# Altium schematic sheet CH32L103F8U-R0.SchDoc
size 304 x 254 mm
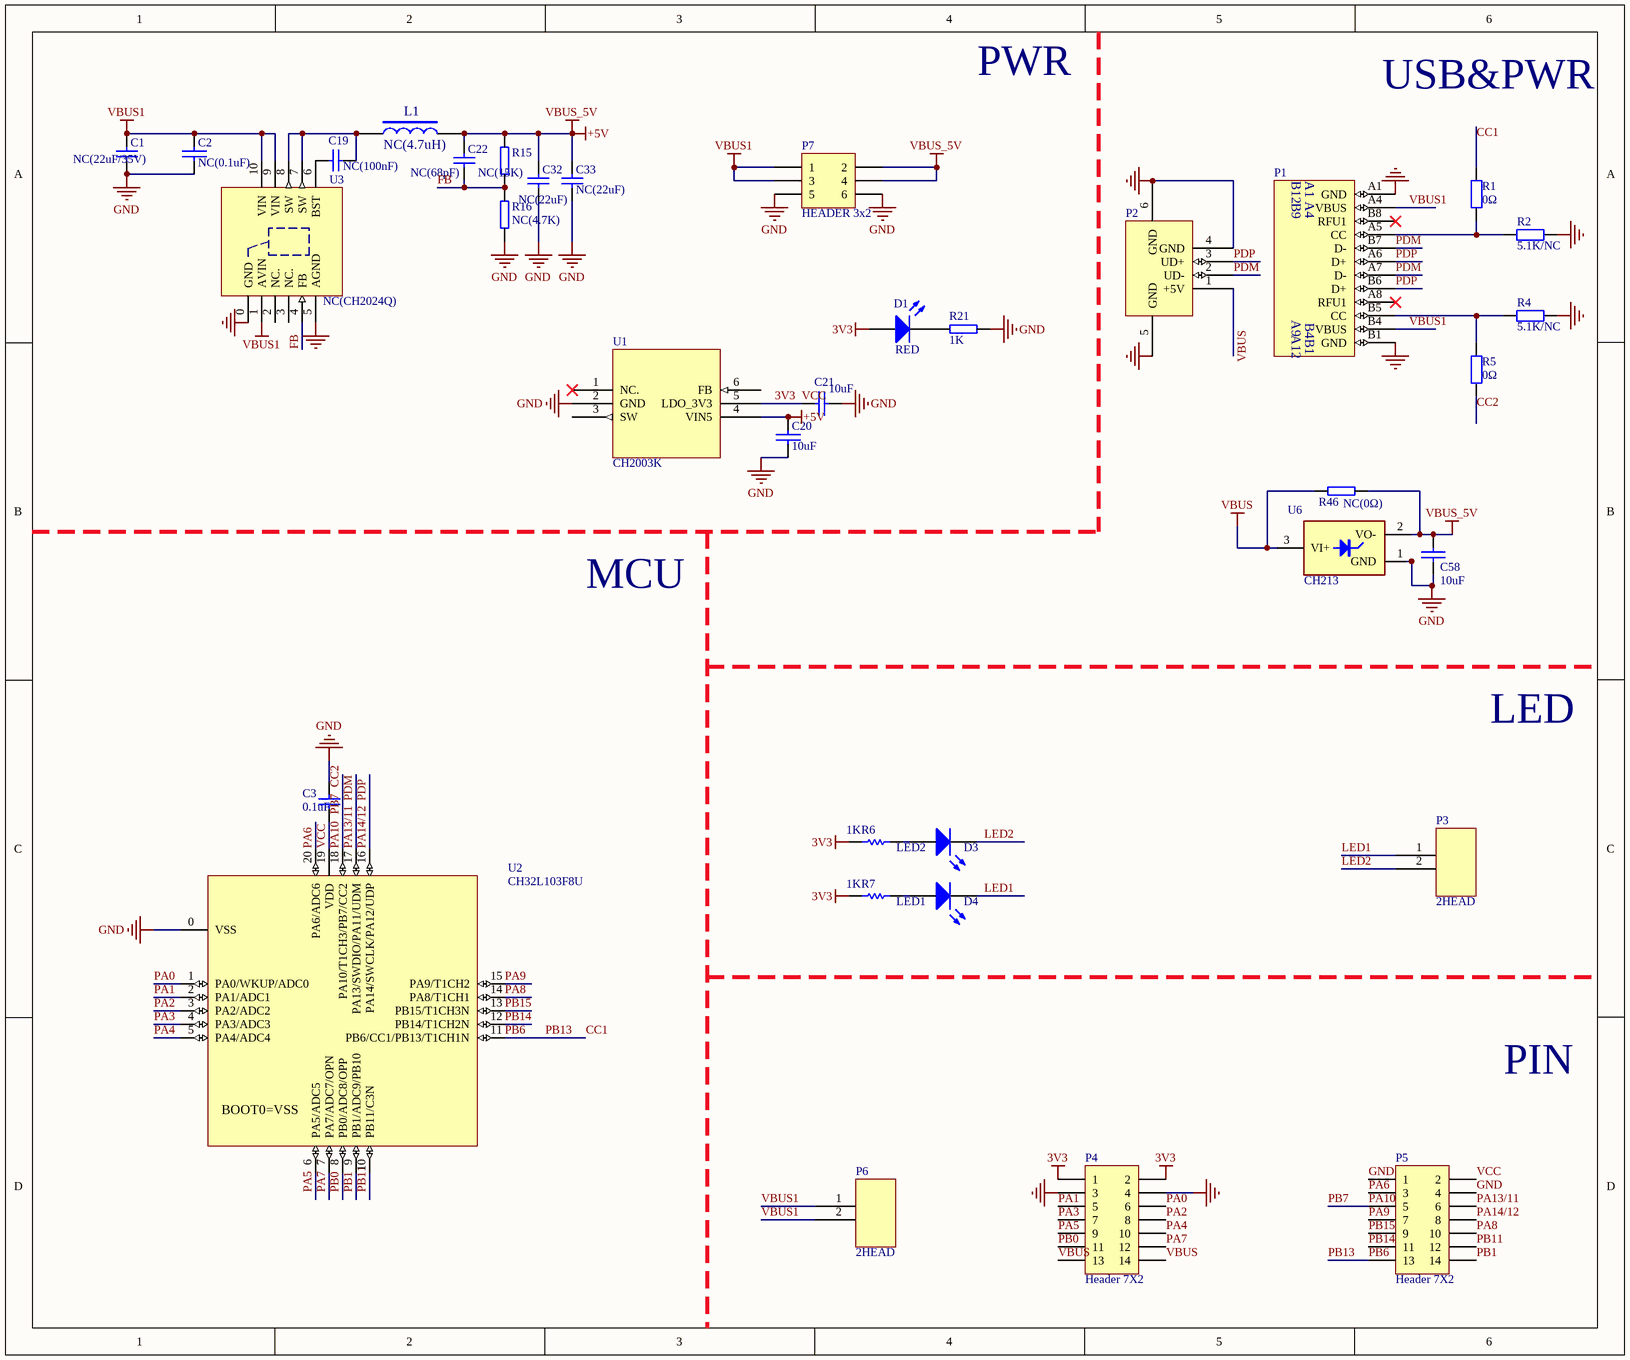
[diagram p0: CH32L103F8U-R0.SchDoc]

## Parts
C1  NC(22uF/35V)  [0805_C]
C2  NC(0.1uF)  [0402_C]
C3  0.1uF  [0603_C]
C19  NC(100nF)  [0402_C]
C20  10uF  [0603_C]
C21  10uF  [0603_C]
C22  NC(68pF)  [0402_C]
C32  NC(22uF)  [0805_C]
C33  NC(22uF)  [0805_C]
C58  10uF  [0603_C]
D1  RED  [0603+]
D3  LED2  [0603+]
D4  LED1  [0603+]
L1  NC(4.7uH)  [IND-SMD_L7.0-W6.6]
P1  TYPE-C  [TYPE-C-Receptacle-2.0]  (value not drawn)
P2  USB_A  [USBAF]  (value not drawn)
P3  2HEAD  [SIP2-2.54mm]
P4  Header 7X2  [IDC14-2.54mm]
P5  Header 7X2  [IDC14-2.54mm]
P6  2HEAD  [SIP2-2.54mm]
P7  HEADER 3x2  [IDC6-2.54mm]
R1  0Ω  [0603]
R2  5.1K/NC  [0603]
R4  5.1K/NC  [0603]
R5  0Ω  [0603]
R6  1K  [0603]
R7  1K  [0603]
R15  NC(15K)  [0402]
R16  NC(4.7K)  [0402]
R21  1K  [0402]
R46  NC(0Ω)  [0402]
U1  CH2003K  [SOT-23-6]
U2  CH32L103F8U  [QFN20_3X3]
U3  NC(CH2024Q)  [DFN10_3X3]
U6  CH213  [SOT-23-3]

## Nets
3V3: C3.1 C21.2 D1.1(A) P4.1 P4.2 P5.2 R6.1 R7.1 U1.5(LDO_3V3) U2.19(VDD)  [also labelled VCC]
+5V: C20.2 C22.1 C32.2 C33.2 C58.1 L1.2 P7.2 P7.4 R15.2 R46.1 U1.4(VIN5) U6.2(VO-)  [also labelled VBUS_5V]
GND: C1.1 C2.1 C3.2 C20.1 C21.1 C32.1 C33.1 C58.2 P1.A1(GND) P1.B1(GND) P2.4(GND) P2.5(GND) P2.6(GND) P4.3 P4.4 P5.1 P5.4 P7.5 P7.6 R2.2 R4.2 R16.1 R21.2 U1.2(GND) U2.0(VSS) U3.0(GND) U3.5(AGND) U6.1(GND)
VBUS: P2.1(+5V) P4.13 P4.14 R46.2 U6.3(VI+)
VBUS1: C1.2 C2.2 P1.A4(VBUS) P1.B4(VBUS) P6.1 P6.2 P7.1 P7.3 U3.1(AVIN) U3.9(VIN) U3.10(VIN)
CC1: P5.13 R1.2 U2.11(PB6/CC1/PB13/T1CH1N)  [also labelled PB13, PB6]
CC2: P5.5 R5.1 U2.18(PA10/T1CH3/PB7/CC2)  [also labelled PA10, PB7]
FB: C22.2 R15.1 R16.2 U3.4(FB)
LED1: D4.2(K) P3.1
LED2: D3.2(K) P3.2
PA0: P4.6 U2.1(PA0/WKUP/ADC0)
PA1: P4.5 U2.2(PA1/ADC1)
PA2: P4.8 U2.3(PA2/ADC2)
PA3: P4.7 U2.4(PA3/ADC3)
PA4: P4.10 U2.5(PA4/ADC4)
PA5: P4.9 U2.6(PA5/ADC5)
PA6: P5.3 U2.20(PA6/ADC6)
PA7: P4.12 U2.7(PA7/ADC7/OPN)
PA8: P5.10 U2.14(PA8/T1CH1)
PA9: P5.7 U2.15(PA9/T1CH2)
PA13/11: P1.A7(D-) P1.B7(D-) P2.2(UD-) P5.6 U2.17(PA13/SWDIO/PA11/UDM)  [also labelled PDM]
PA14/12: P1.A6(D+) P1.B6(D+) P2.3(UD+) P5.8 U2.16(PA14/SWCLK/PA12/UDP)  [also labelled PDP]
PB0: P4.11 U2.8(PB0/ADC8/OPP)
PB1: P5.14 U2.9(PB1/ADC9/PB10)
PB11: P5.12 U2.10(PB11/C3N)
PB14: P5.11 U2.12(PB14/T1CH2N)
PB15: P5.9 U2.13(PB15/T1CH3N)
NetC19_1: C19.1 U3.6(BST)
NetC19_2: C19.2 L1.1 U3.7(SW) U3.8(SW)
NetD1_2: D1.2(K) R21.1
NetD3_1: D3.1(A) R6.2
NetD4_1: D4.1(A) R7.2
NetP1_A5: P1.A5(CC) R1.1 R2.1
NetP1_B5: P1.B5(CC) R4.1 R5.2

Not connected (* = marked no-connect by the designer): P1 A8(RFU1)* B8(RFU1)*; U1 1(NC.)* 3(SW) 6(FB); U3 2(NC.) 3(NC.)

## Notes on the sheet
- PWR
- USB&PWR
- MCU
- LED
- PIN
- (in symbol CH32L103F8U) BOOT0=VSS
- (in symbol TYPE-C1) B12; B9; A9; A12

## Library data of the parts
C1 C22 C32 C33 = 0603 100nF (104) 10% 50V: 贴片电容; ComponentLink1Description: 供应商链接; ComponentLink1URL: http://www.szlcsc.com/product/details_15331.html; Package: 0603; Supplier: LC; SuppliersPartNumber: C14663
C2 C20 C21 C58 = CAP: Capacitor
C3 = Cap: Capacitor; Value: 15pF; Published: 8-Jun-2000; LatestRevisionDate: 17-Jul-2002; LatestRevisionNote: Re-released for DXP Platform.; PackageReference: RAD-0.3; Publisher: Altium Limited
C19 = 0603 1uF (105) 10% 50V: 贴片电容; ComponentLink1Description: 供应商链接; ComponentLink1URL: http://www.szlcsc.com/product/details_16531.html; Package: 0603; Supplier: LC; SuppliersPartNumber: C15849
D1 D3 D4 = LED0: Typical INFRARED GaAs LED; Published: 8-Jun-2000; LatestRevisionDate: 08-Jul-2005; LatestRevisionNote: Mech Layer 1 removed.; PackageReference: LED-0; Publisher: Altium Limited
  D1: PackageDescription: LED; 2 Leads
L1 = INDUCTOR
P1 = TYPE-C1
P2 = USB: USB Port
P4 P5 = Header 7X2: Header, 7-Pin, Dual row; LatestRevisionDate: 17-Jul-2002; LatestRevisionNote: Re-released for DXP Platform.; Publisher: Altium Limited
P7 = HEADER 3x2: Header, 3-Pin, Dual row
R1 R2 R4 R5 = Res2: Resistor
R6 R7 = Res Semi: Semiconductor Resistor
R15 R16 R21 R46 = RES
U1 = CH2003K: Step-Down DC-DC Converter, 5V input, FB 0.6V, 800mA output, with LDO 3.3V * 200mA
U2 = CH32L103F8U: RISC-V LMD-MCU, 96MHz, USB, Type-C/PD-5K1, CAN, OPA, lower power
U3 = CH2024Q: Step-Down DC-DC Converter, 28V input, FB 1.2V, 3A output
U6 = CH213E: Ideal Diode 5V*1A